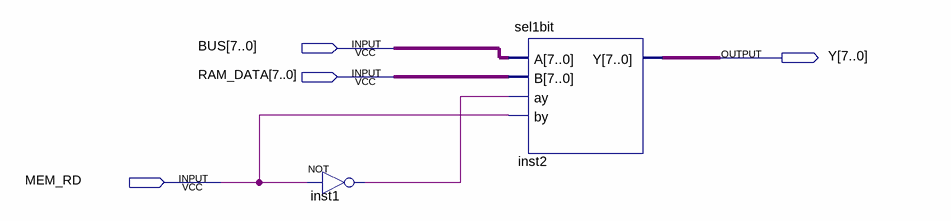
[diagram p0: schematic sheet]
// Quartus schematic MDR_mux_hxgdly.bdf as structural Verilog: 2 symbols, 4 pins
module MDR_mux_hxgdly (
  input  [7:0] BUS,
  input  [7:0] RAM_DATA,
  input  MEM_RD,
  output [7:0] Y
);

  wire inst1_out;

  not inst1 (inst1_out, MEM_RD);
  sel1bit inst2 (.A(BUS), .B(RAM_DATA), .ay(inst1_out), .by(MEM_RD), .Y(Y));
endmodule
